# Altium schematic sheet PCB-MAIN_04_GNSS.SchDoc
size 594 x 420 mm
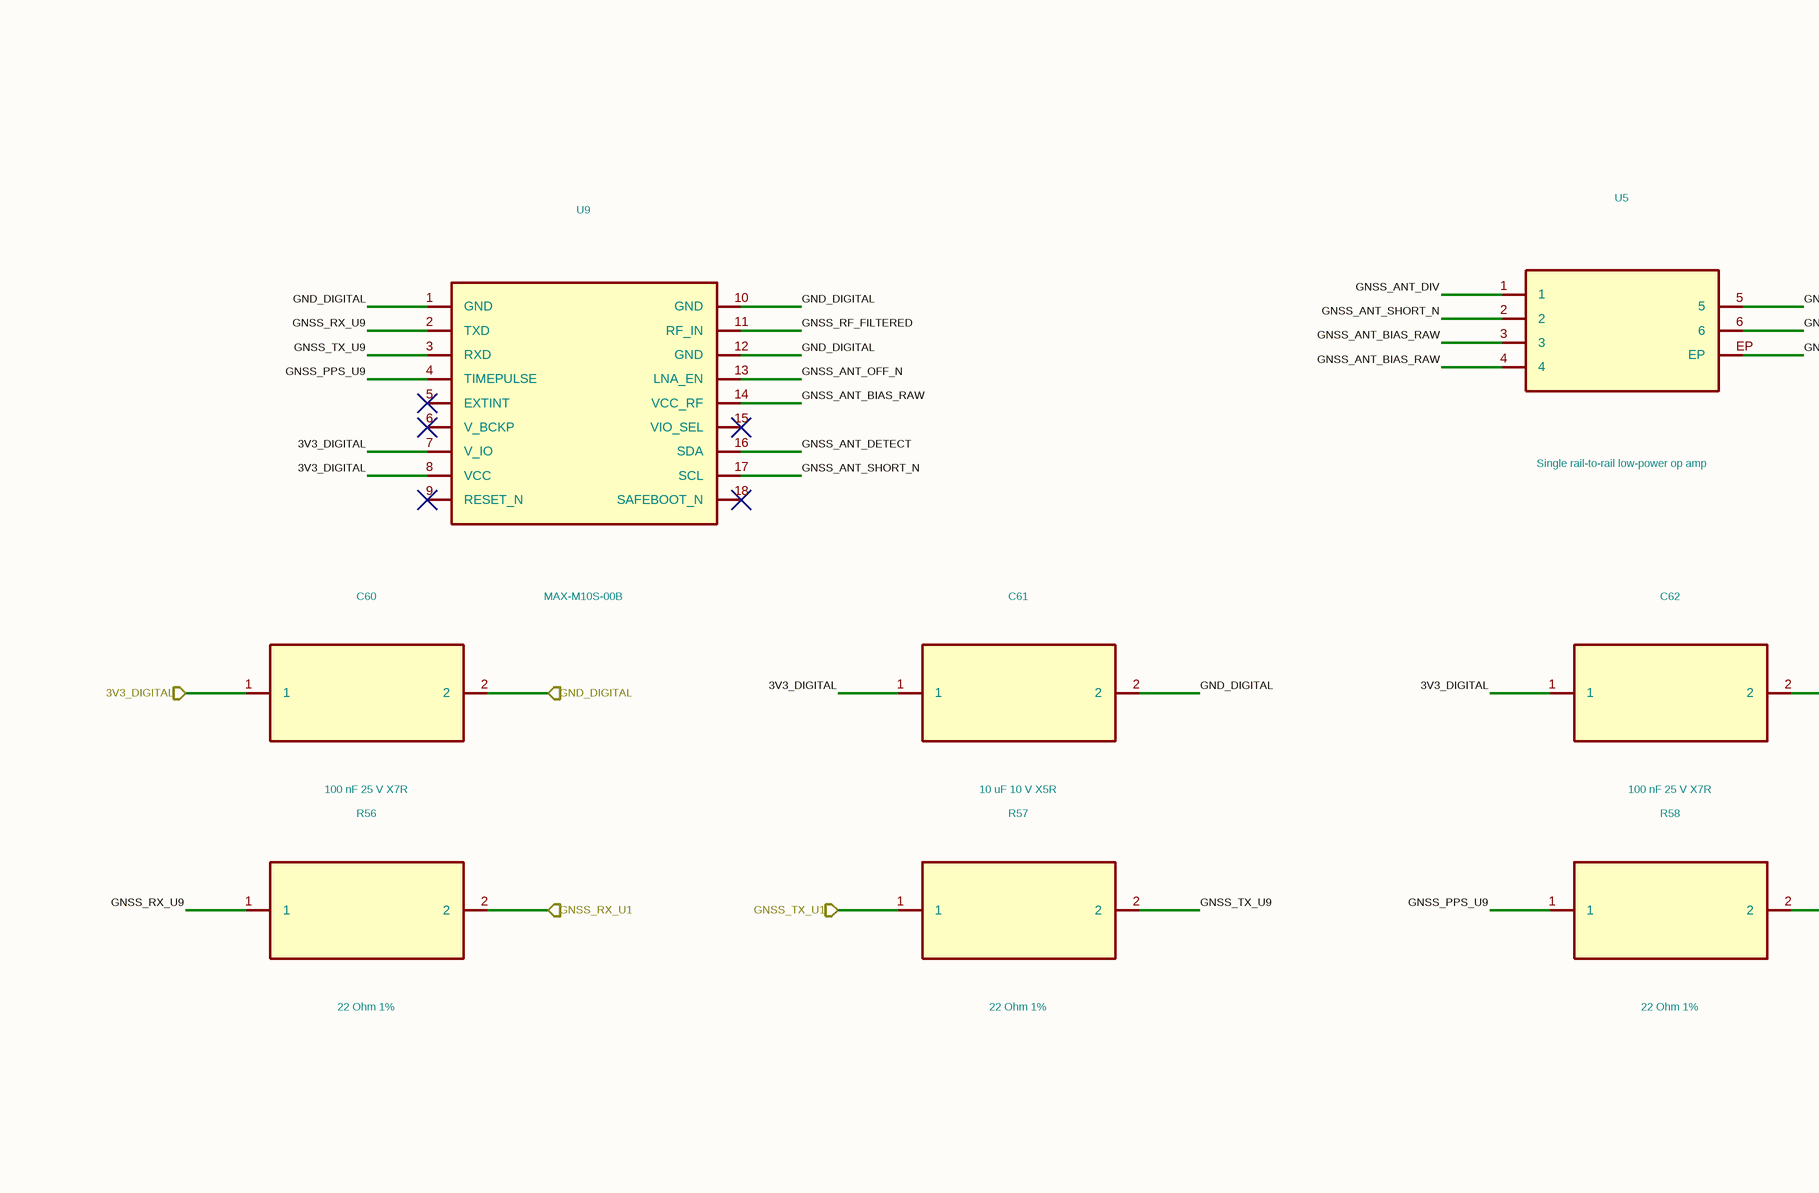
[diagram p0: PCB-MAIN_04_GNSS.SchDoc, top left]
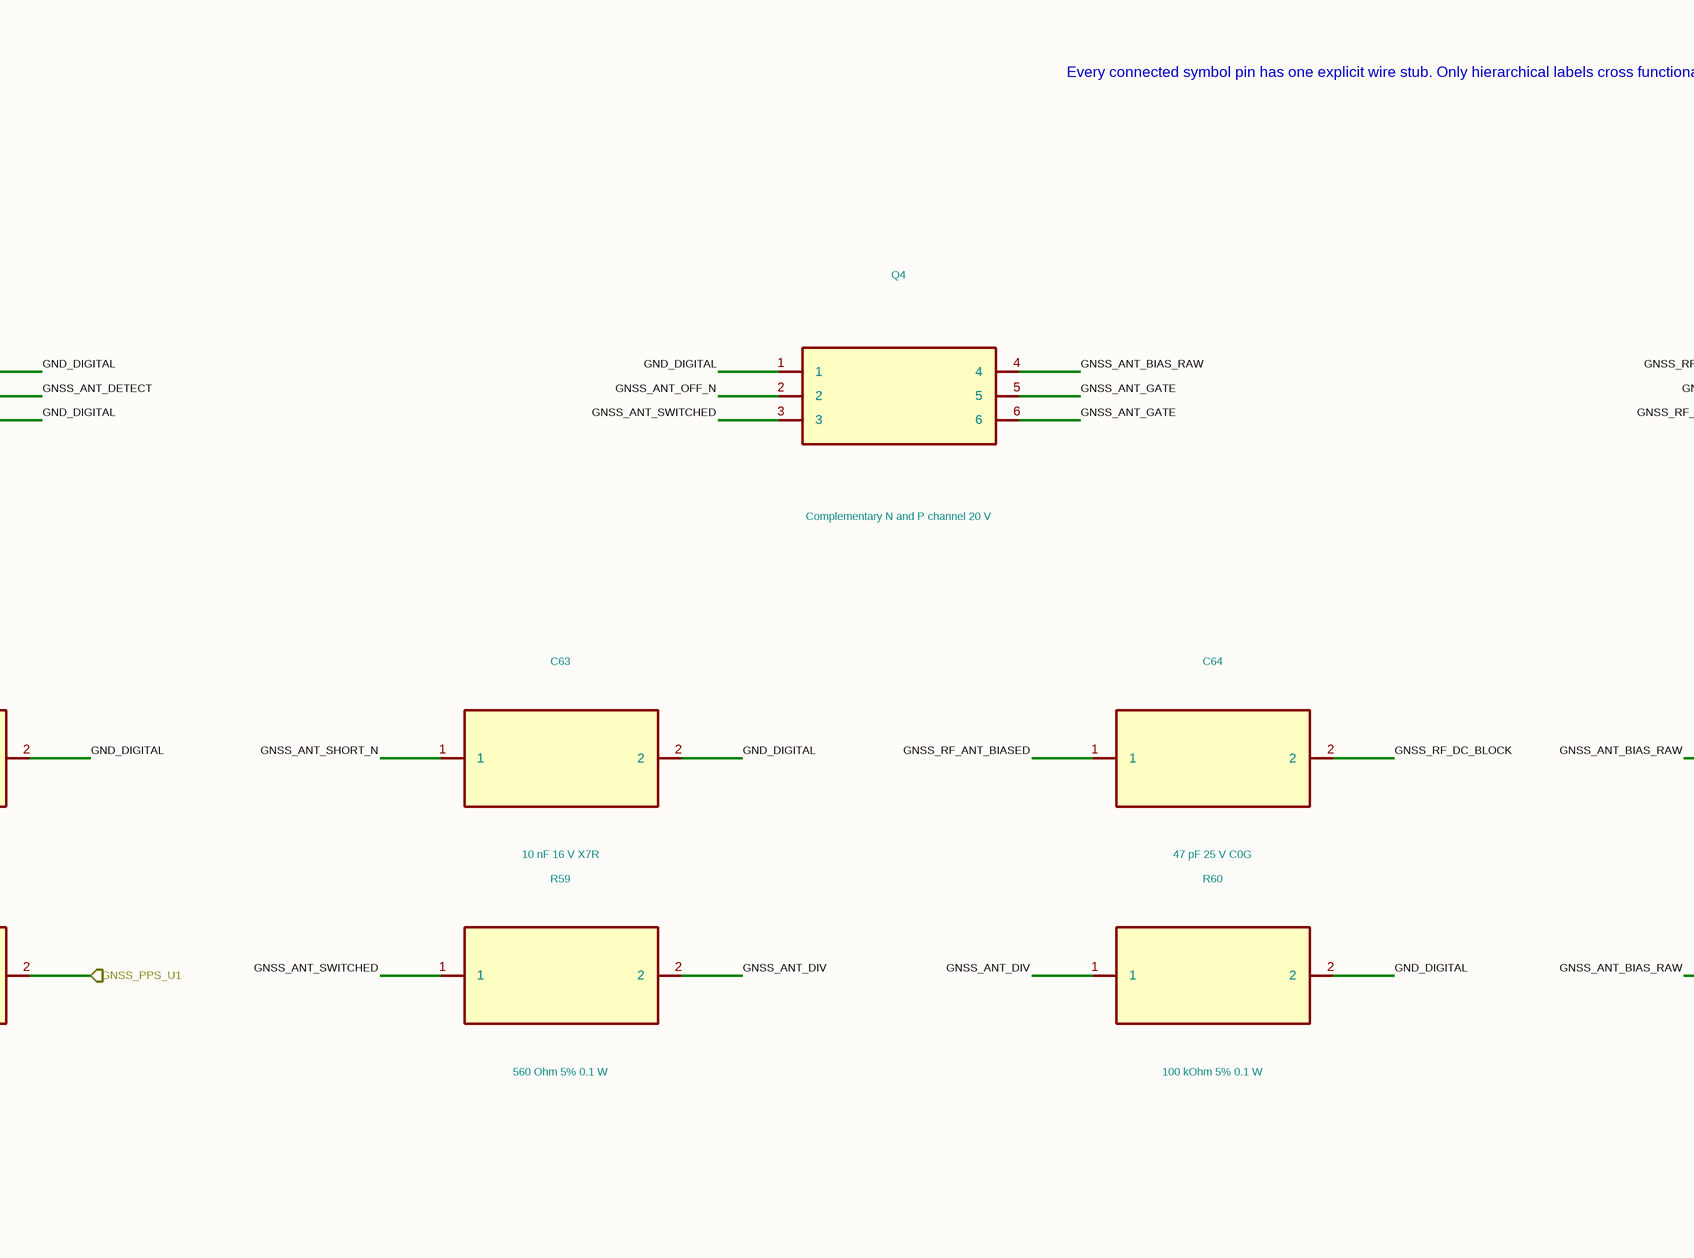
[diagram p1: PCB-MAIN_04_GNSS.SchDoc, top middle]
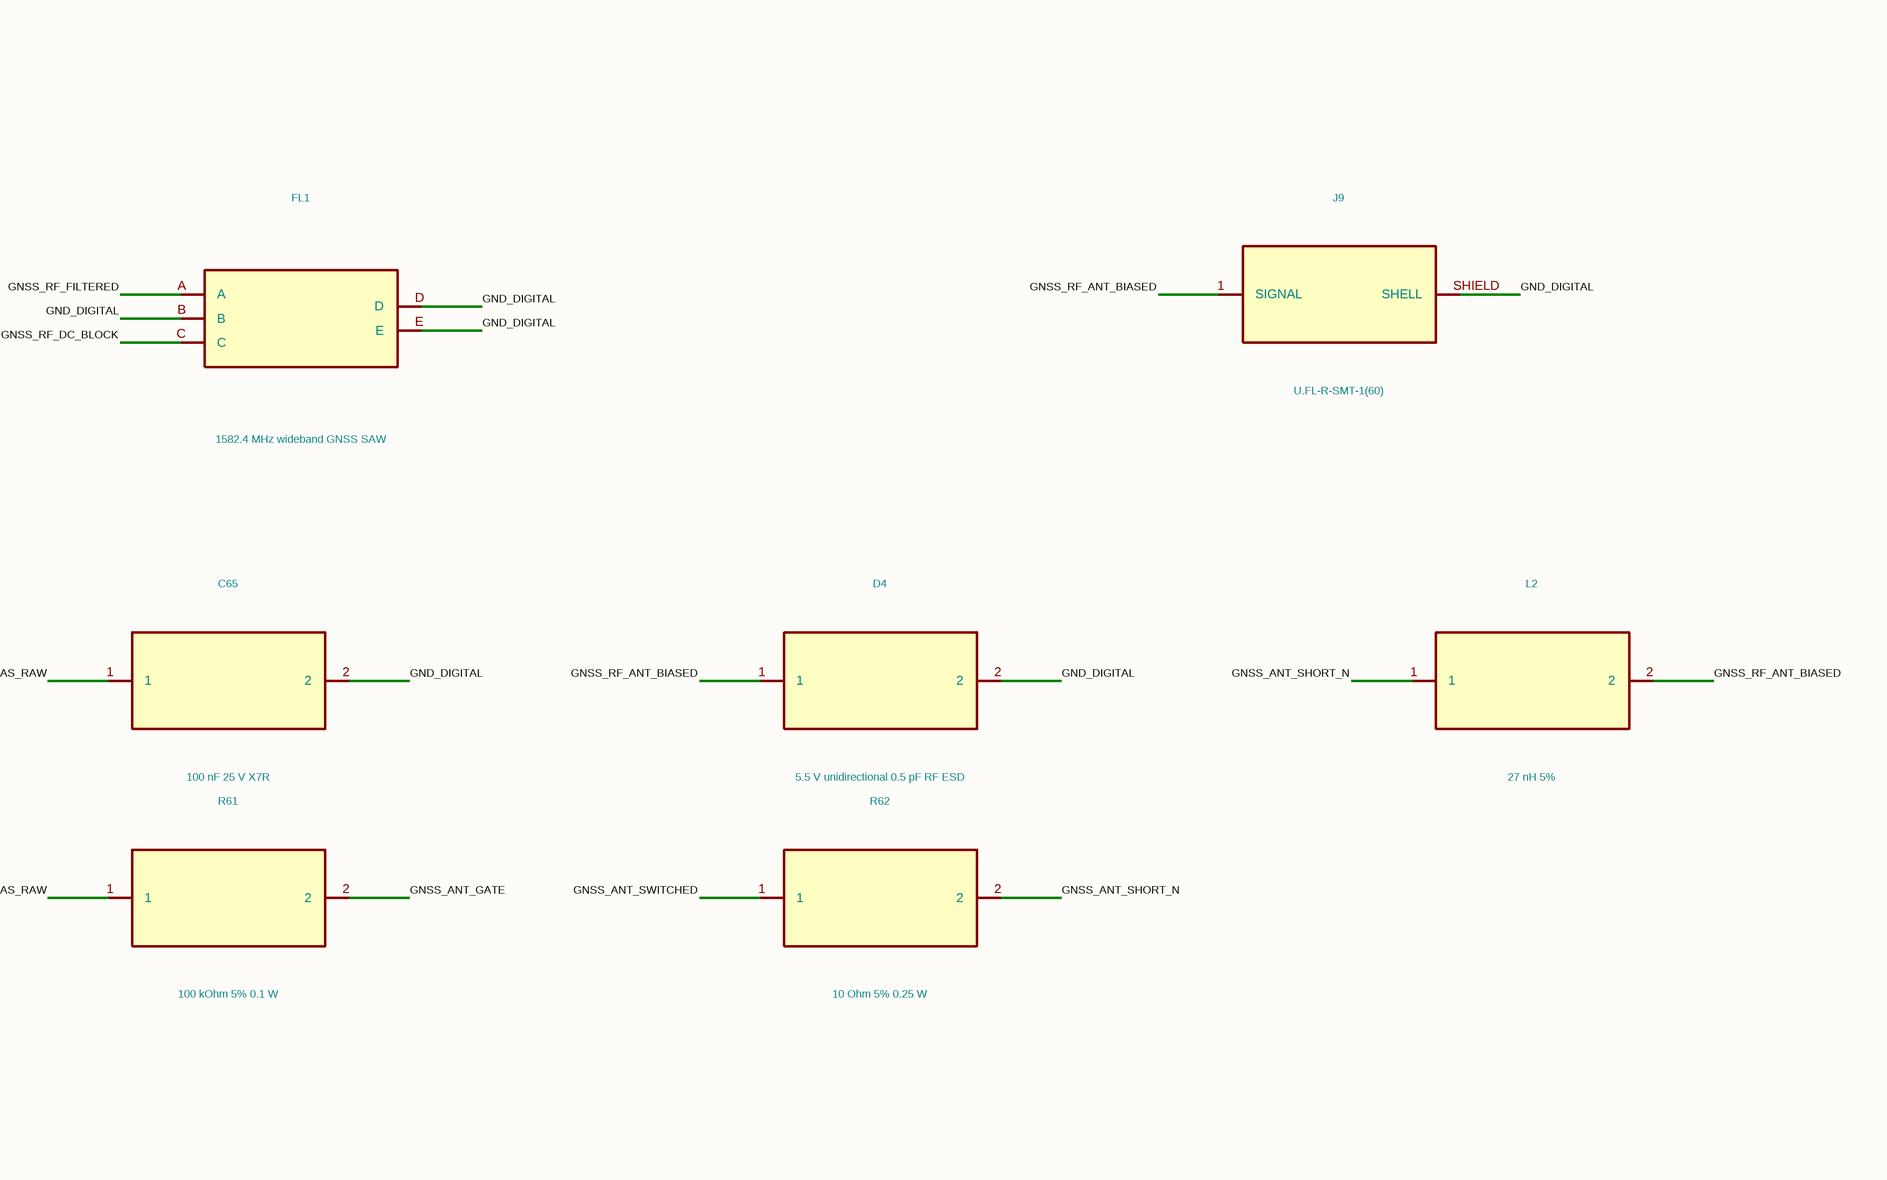
[diagram p2: PCB-MAIN_04_GNSS.SchDoc, top right]
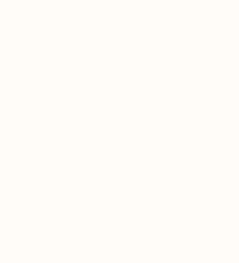
[diagram p3: PCB-MAIN_04_GNSS.SchDoc, bottom left]

## Parts
C60  100 nF 25 V X7R  [C_0402_1005Metric]
C61  10 uF 10 V X5R  [C_0603_1608Metric]
C62  100 nF 25 V X7R  [C_0402_1005Metric]
C63  10 nF 16 V X7R  [C_0402_1005Metric]
C64  47 pF 25 V C0G  [C_0402_1005Metric]
C65  100 nF 25 V X7R  [C_0402_1005Metric]
D4  5.5 V unidirectional 0.5 pF RF ESD
FL1  1582.4 MHz wideband GNSS SAW
J9  U.FL-R-SMT-1(60)
L2  27 nH 5%  [L_0402_1005Metric]
Q4  Complementary N and P channel 20 V
R56  22 Ohm 1%  [R_0402_1005Metric]
R57  22 Ohm 1%  [R_0402_1005Metric]
R58  22 Ohm 1%  [R_0402_1005Metric]
R59  560 Ohm 5% 0.1 W  [R_0402_1005Metric]
R60  100 kOhm 5% 0.1 W  [R_0402_1005Metric]
R61  100 kOhm 5% 0.1 W  [R_0402_1005Metric]
R62  10 Ohm 5% 0.25 W  [R_1206_3216Metric]
U5  Single rail-to-rail low-power op amp
U9  MAX-M10S-00B

## Ports
3V3_DIGITAL, GND_DIGITAL, GNSS_PPS_U1, GNSS_RX_U1, GNSS_TX_U1

## Nets
3V3_DIGITAL: C60.1 ; port 3V3_DIGITAL
3V3_DIGITAL: C61.1 C62.1 U9.7(V_IO) U9.8(VCC)  [a separate net that carries the same name]
GND_DIGITAL: C60.2 ; port GND_DIGITAL
GND_DIGITAL: C61.2 C62.2 C63.2 C65.2 D4.2 FL1.B FL1.D FL1.E J9.SHIELD(SHELL) Q4.1 R60.2 U5.5 U5.EP U9.1(GND) U9.10(GND) U9.12(GND)  [a separate net that carries the same name]
GNSS_ANT_BIAS_RAW: C65.1 Q4.4 R61.1 U5.3 U5.4 U9.14(VCC_RF)
GNSS_ANT_DETECT: U5.6 U9.16(SDA)
GNSS_ANT_DIV: R59.2 R60.1 U5.1
GNSS_ANT_GATE: Q4.5 Q4.6 R61.2
GNSS_ANT_OFF_N: Q4.2 U9.13(LNA_EN)
GNSS_ANT_SHORT_N: C63.1 L2.1 R62.2 U5.2 U9.17(SCL)
GNSS_ANT_SWITCHED: Q4.3 R59.1 R62.1
GNSS_PPS_U1: R58.2 ; port GNSS_PPS_U1
GNSS_PPS_U9: R58.1 U9.4(TIMEPULSE)
GNSS_RF_ANT_BIASED: C64.1 D4.1 J9.1(SIGNAL) L2.2
GNSS_RF_DC_BLOCK: C64.2 FL1.C
GNSS_RF_FILTERED: FL1.A U9.11(RF_IN)
GNSS_RX_U1: R56.2 ; port GNSS_RX_U1
GNSS_RX_U9: R56.1 U9.2(TXD)
GNSS_TX_U1: R57.1 ; port GNSS_TX_U1
GNSS_TX_U9: R57.2 U9.3(RXD)

Not connected (* = marked no-connect by the designer): U9 5(EXTINT)* 6(V_BCKP)* 9(RESET_N)* 15(VIO_SEL)* 18(SAFEBOOT_N)*

## Notes on the sheet
- Every connected symbol pin has one explicit wire stub. Only hierarchical labels cross functional-sheet boundaries.
- 1
- 2
- 3
- 4
- 5
- 6
- 7
- 8
- 9
- 10
- 11
- A
- B
- C
- D
- E
- F
- G
- H
- Human-readable hierarchy candidate; exact Review-A pin/net equivalence enforced
- Functional sheet 5 of 10
- NOT FOR MANUFACTURE - hierarchy review/routing/DRC/DFM/Review B pending
- Title: Dioneya PCB-MAIN Rev.A - GNSS
- File: PCB-MAIN_04_GNSS.kicad_sch
- Sheet: /
- Dioneya / ZS-BPLA
- KiCad E.D.A.  kicad (5.1.4)-1
- Size: A2
- Date: 2026-09-16
- Rev: A
- Id: 1/1

## Library data of the parts
C60 = C60_GRM155R71E104KE14D: Manufacturer: Murata; Population: FITTED; Authority: u-blox_UBX-20053088_R05; MPN: GRM155R71E104KE14D; Package: 0402; Value: 100 nF 25 V X7R; Footprint: Capacitor_SMD:C_0402_1005Metric
C61 = C61_GRM188R61A106KE69D: Manufacturer: Murata; Population: FITTED; Authority: u-blox_UBX-20053088_R05; MPN: GRM188R61A106KE69D; Package: 0603; Value: 10 uF 10 V X5R; Footprint: Capacitor_SMD:C_0603_1608Metric
C62 = C62_GRM155R71E104KE14D: Manufacturer: Murata; Population: FITTED; Authority: u-blox_UBX-20053088_R05; MPN: GRM155R71E104KE14D; Package: 0402; Value: 100 nF 25 V X7R; Footprint: Capacitor_SMD:C_0402_1005Metric
C63 = C63_GRM155R71C103KA01D: Manufacturer: Murata; Population: FITTED; Authority: u-blox_UBX-20053088_R05; MPN: GRM155R71C103KA01D; Package: 0402; Value: 10 nF 16 V X7R; Footprint: Capacitor_SMD:C_0402_1005Metric
C64 = C64_GRM1555C1E470JA01D: Manufacturer: Murata; Population: FITTED; Authority: u-blox_UBX-20053088_R05; MPN: GRM1555C1E470JA01D; Package: 0402; Value: 47 pF 25 V C0G; Footprint: Capacitor_SMD:C_0402_1005Metric
C65 = C65_GRM155R71E104KE14D: Manufacturer: Murata; Population: FITTED; Authority: ADI_LT6000_datasheet; MPN: GRM155R71E104KE14D; Package: 0402; Value: 100 nF 25 V X7R; Footprint: Capacitor_SMD:C_0402_1005Metric
D4 = D4_TPD1E05U06DYAR: Manufacturer: Texas Instruments; Population: FITTED; Authority: TI_TPDxE05U06_RevO; MPN: TPD1E05U06DYAR; Package: SOD-523_DYA; Value: 5.5 V unidirectional 0.5 pF RF ESD
FL1 = FL1_ABSES5AF-L100KM: Manufacturer: Abracon; Population: FITTED; Authority: Abracon_ABSES5AF-L100KM_2025-09-16; MPN: ABSES5AF-L100KM; Package: 1109-5; Value: 1582.4 MHz wideband GNSS SAW
J9 = J9_U.FL-R-SMT-1_60: Manufacturer: CONTROLLED_AUTHORITY; Population: FITTED; Authority: PCB_MAIN_GNSS_PIN_AUTHORITY_REV_A.csv;PCB_MAIN_CONNECTOR_FIXTURE_PIN_AUTHORITY_REV_A.csv; MPN: U.FL-R-SMT-1(60); Package: U.FL_SMT; Value: U.FL-R-SMT-1(60)
L2 = L2_LQW15AN27NJ00D: Manufacturer: Murata; Population: FITTED; Authority: u-blox_UBX-20053088_R05; MPN: LQW15AN27NJ00D; Package: 0402; Value: 27 nH 5%; Footprint: Inductor_SMD:L_0402_1005Metric
Q4 = Q4_Si1016X-T1-GE3: Manufacturer: Vishay; Population: FITTED; Authority: Vishay_Si1016X_RevE; MPN: Si1016X-T1-GE3; Package: SOT-563_SC-89; Value: Complementary N and P channel 20 V
R56 = R56_ERJ-2RKF22R0X: Manufacturer: Panasonic; Population: FITTED; Authority: u-blox_UBX-20053088_R05; MPN: ERJ-2RKF22R0X; Package: 0402; Value: 22 Ohm 1%; Footprint: Resistor_SMD:R_0402_1005Metric
R57 = R57_ERJ-2RKF22R0X: Manufacturer: Panasonic; Population: FITTED; Authority: u-blox_UBX-20053088_R05; MPN: ERJ-2RKF22R0X; Package: 0402; Value: 22 Ohm 1%; Footprint: Resistor_SMD:R_0402_1005Metric
R58 = R58_ERJ-2RKF22R0X: Manufacturer: Panasonic; Population: FITTED; Authority: u-blox_UBX-20053088_R05; MPN: ERJ-2RKF22R0X; Package: 0402; Value: 22 Ohm 1%; Footprint: Resistor_SMD:R_0402_1005Metric
R59 = R59_ERJ-2GEJ561X: Manufacturer: Panasonic; Population: FITTED; Authority: u-blox_UBX-20053088_R05; MPN: ERJ-2GEJ561X; Package: 0402; Value: 560 Ohm 5% 0.1 W; Footprint: Resistor_SMD:R_0402_1005Metric
R60 = R60_ERJ-2GEJ104X: Manufacturer: Panasonic; Population: FITTED; Authority: u-blox_UBX-20053088_R05; MPN: ERJ-2GEJ104X; Package: 0402; Value: 100 kOhm 5% 0.1 W; Footprint: Resistor_SMD:R_0402_1005Metric
R61 = R61_ERJ-2GEJ104X: Manufacturer: Panasonic; Population: FITTED; Authority: u-blox_UBX-20053088_R05; MPN: ERJ-2GEJ104X; Package: 0402; Value: 100 kOhm 5% 0.1 W; Footprint: Resistor_SMD:R_0402_1005Metric
R62 = R62_ERJ-8GEYJ100V: Manufacturer: Panasonic; Population: FITTED; Authority: u-blox_UBX-20053088_R05; MPN: ERJ-8GEYJ100V; Package: 1206; Value: 10 Ohm 5% 0.25 W; Footprint: Resistor_SMD:R_1206_3216Metric
U5 = U5_LT6000IDCB_TRMPBF: Manufacturer: Analog Devices; MPN: LT6000IDCB#TRMPBF; Population: FITTED; Authority: ADI_LT6000_datasheet; Package: DFN-6_DCB_2x3mm; Value: Single rail-to-rail low-power op amp
U9 = U9_MAX-M10S-00B: Manufacturer: u-blox; Population: FITTED; Authority: PCB_MAIN_GNSS_PIN_AUTHORITY_REV_A.csv; MPN: MAX-M10S-00B; Package: LCC-18_9.7x10.1mm; Value: MAX-M10S-00B